# Altium schematic sheet MCU_RP2040.SchDoc: 06 - Controlador deterministico RP2040
size A3; Project: CM5 Photonic Bias Controller; DocumentRev: R5; ProjectRev: R5; Version: Rev R6; SheetNumber: 7; SheetTotal: 17; Author: Carlos Renan; SCH_SCALE: N/A; Address1: UFCG; Address2: Referencia: VIRTUS CC; Address3: Campina Grande - PB; ProjectName: Controle automatico de BIAS para MZM/IQ - Projeto 3; DocumentName: MCU_RP2040.SchDoc
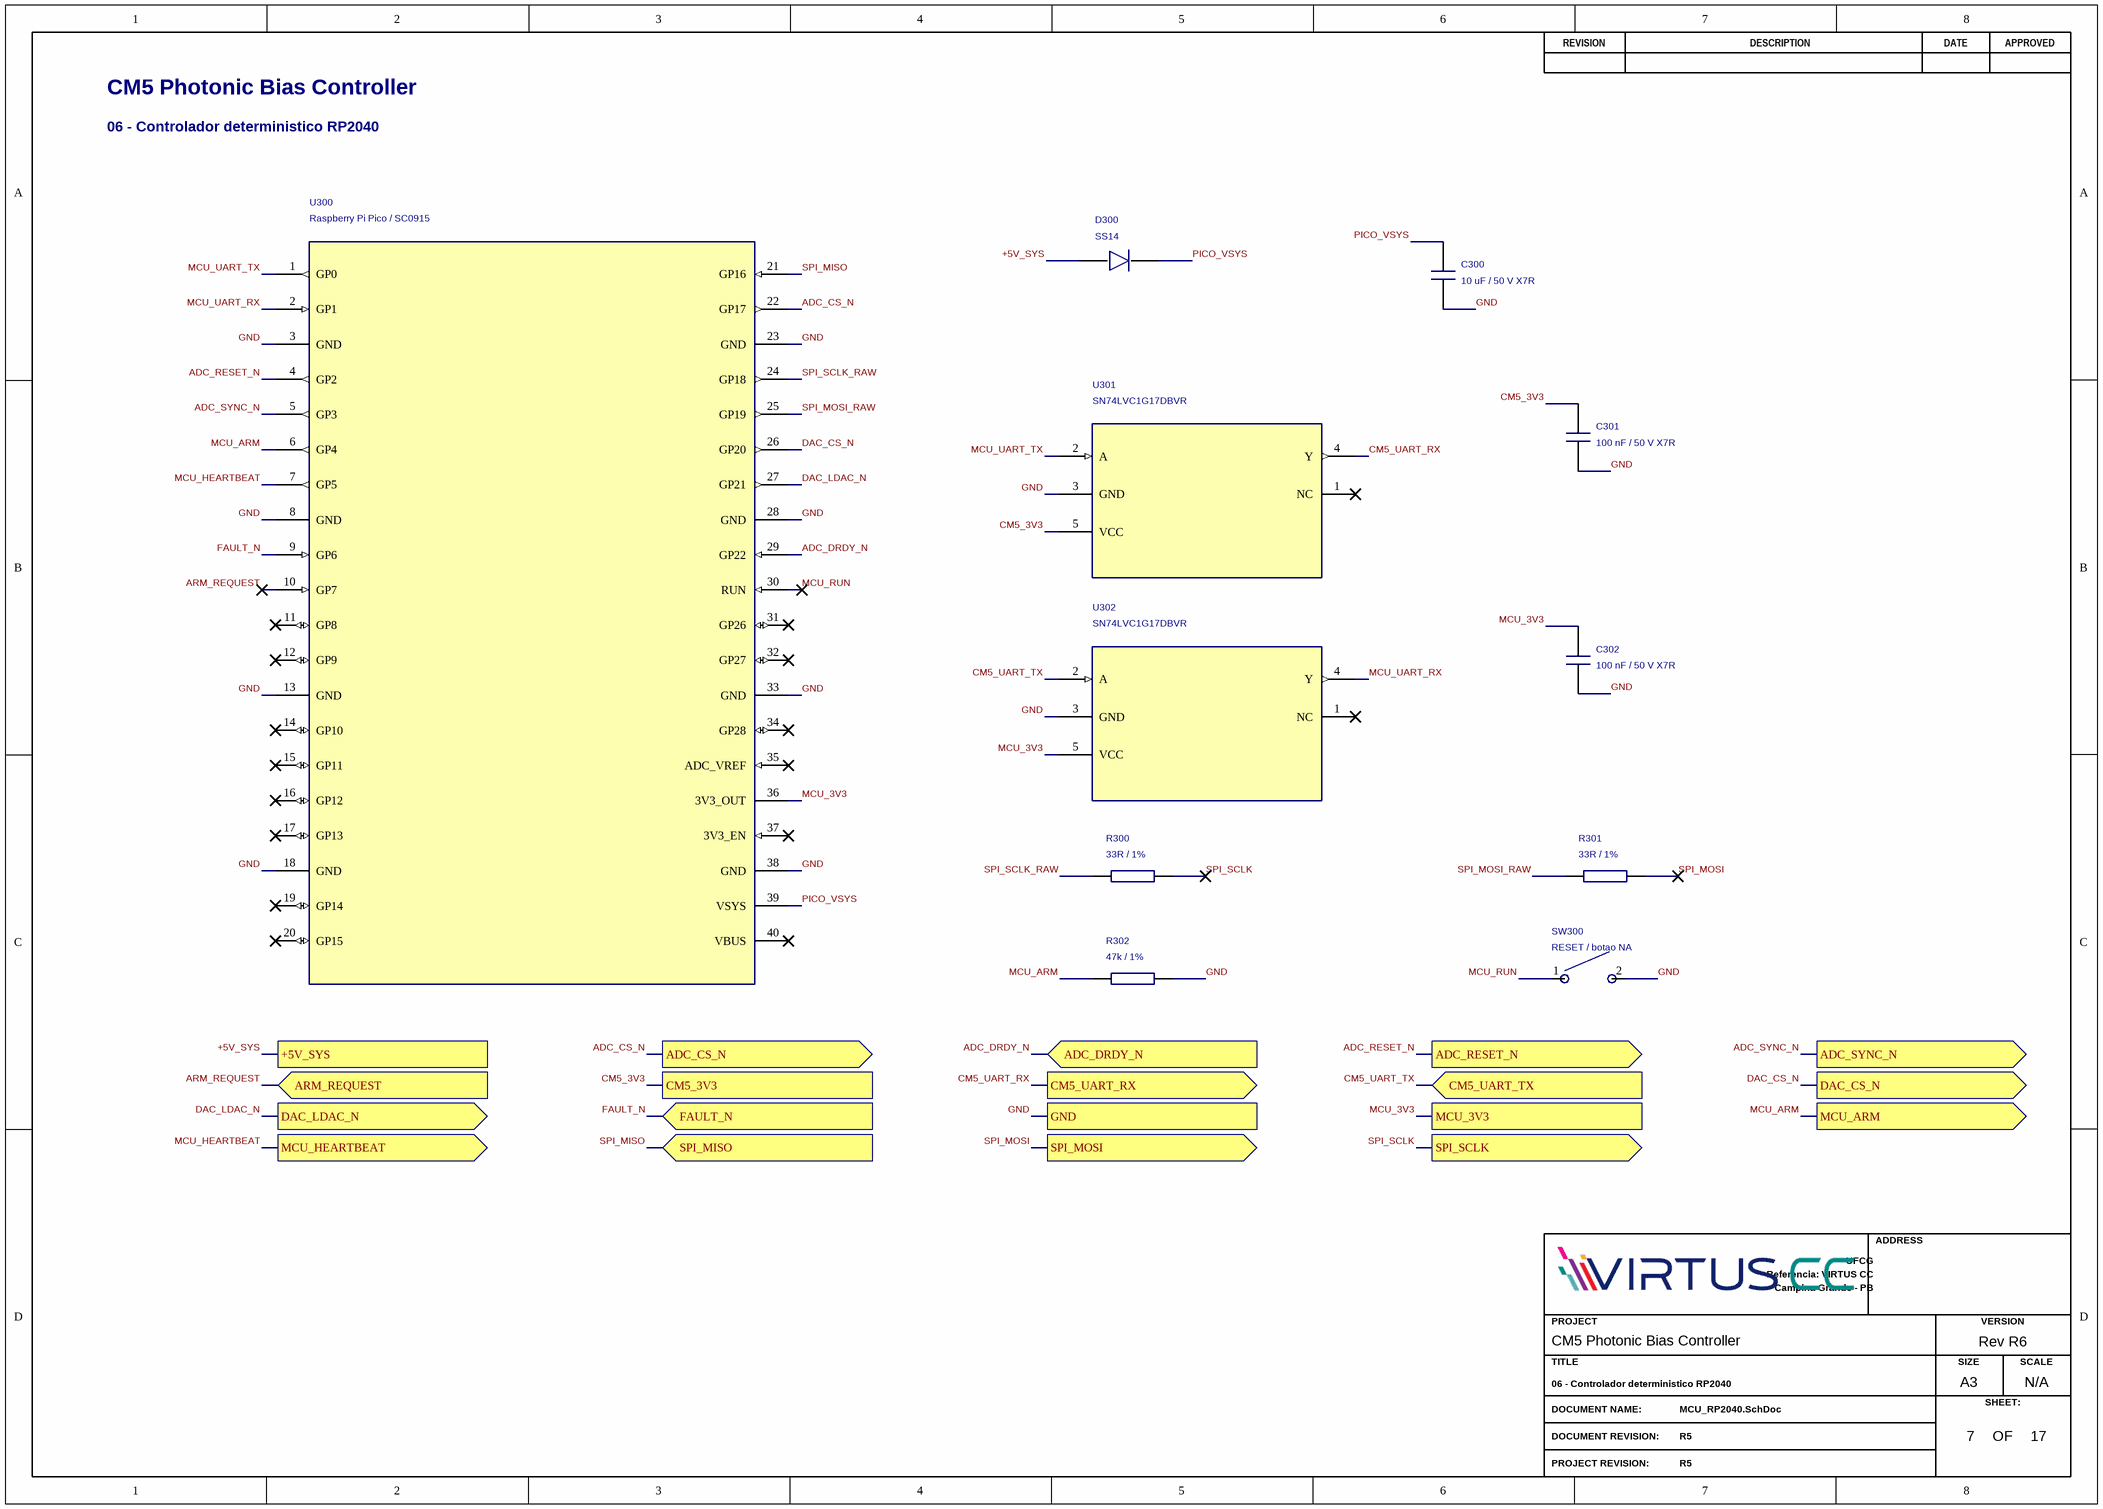
[diagram p0: MCU_RP2040.SchDoc]

## Parts
C300  10 uF / 50 V X7R  [C1210]
C301  100 nF / 50 V X7R  [C0805]
C302  100 nF / 50 V X7R  [C0805]
D300  SS14  [DO-214AC]
R300  33R / 1%  [R-0603]
R301  33R / 1%  [R-0603]
R302  47k / 1%  [R-0603]
SW300  RESET / botao NA  [SW_TL3305A]
U300  Raspberry Pi Pico / SC0915  [PICO_TH40]
U301  SN74LVC1G17DBVR  [FP-C04-091-OT-MFG]
U302  SN74LVC1G17DBVR  [FP-C04-091-OT-MFG]

## Ports
+5V_SYS, ADC_CS_N (out), ADC_DRDY_N (in), ADC_RESET_N (out), ADC_SYNC_N (out), ARM_REQUEST (in), CM5_3V3, CM5_UART_RX (out), CM5_UART_TX (in), DAC_CS_N (out), DAC_LDAC_N (out), FAULT_N (in), GND, MCU_3V3, MCU_ARM (out), MCU_HEARTBEAT (out), SPI_MISO (in), SPI_MOSI (out), SPI_SCLK (out)

## Nets
+5V_SYS: D300.2(A) ; port +5V_SYS
ADC_CS_N: U300.22(GP17) ; port ADC_CS_N
ADC_DRDY_N: U300.29(GP22) ; port ADC_DRDY_N
ADC_RESET_N: U300.4(GP2) ; port ADC_RESET_N
ADC_SYNC_N: U300.5(GP3) ; port ADC_SYNC_N
ARM_REQUEST: U300.10(GP7) ; port ARM_REQUEST
CM5_3V3: C301.1 U301.5(VCC) ; port CM5_3V3
CM5_UART_RX: U301.4(Y) ; port CM5_UART_RX
CM5_UART_TX: U302.2(A) ; port CM5_UART_TX
DAC_CS_N: U300.26(GP20) ; port DAC_CS_N
DAC_LDAC_N: U300.27(GP21) ; port DAC_LDAC_N
FAULT_N: U300.9(GP6) ; port FAULT_N
GND: C300.2 C301.2 C302.2 R302.2 SW300.2 U300.3(GND) U300.8(GND) U300.13(GND) U300.18(GND) U300.23(GND) U300.28(GND) U300.33(GND) U300.38(GND) U301.3(GND) U302.3(GND) ; port GND
MCU_3V3: C302.1 U300.36(3V3_OUT) U302.5(VCC) ; port MCU_3V3
MCU_ARM: R302.1 U300.6(GP4) ; port MCU_ARM
MCU_HEARTBEAT: U300.7(GP5) ; port MCU_HEARTBEAT
MCU_RUN: SW300.1 U300.30(RUN)
MCU_UART_RX: U300.2(GP1) U302.4(Y)
MCU_UART_TX: U300.1(GP0) U301.2(A)
PICO_VSYS: C300.1 D300.1(K) U300.39(VSYS)
SPI_MISO: U300.21(GP16) ; port SPI_MISO
SPI_MOSI: R301.2 ; port SPI_MOSI
SPI_MOSI_RAW: R301.1 U300.25(GP19)
SPI_SCLK: R300.2 ; port SPI_SCLK
SPI_SCLK_RAW: R300.1 U300.24(GP18)

Not connected (* = marked no-connect by the designer): U300 11(GP8)* 12(GP9)* 14(GP10)* 15(GP11)* 16(GP12)* 17(GP13)* 19(GP14)* 20(GP15)* 31(GP26)* 32(GP27)* 34(GP28)* 35(ADC_VREF)* 37(3V3_EN)* 40(VBUS)*; U301 1(NC)*; U302 1(NC)*

## Notes on the sheet
- CM5 Photonic Bias Controller
- 06 - Controlador deterministico RP2040
- REVISION
- DESCRIPTION
- DATE
- APPROVED
- ADDRESS
- PROJECT
- VERSION
- TITLE
- A3
- SIZE
- SCALE
- DOCUMENT NAME:
- DOCUMENT REVISION:
- OF
- SHEET:
- PROJECT REVISION:

## Library data of the parts
C300 = 10 uF: Manufacturer: KEMET; Manufacturer Part Number: C1210C106K5RACTU; Procurement Status: Busca por MPN; SKU e disponibilidade a confirmar; BOM Purchase: Yes; Manufacturer 1: KEMET; Manufacturer Part Number 1: C1210C106K5RACTU; Supplier 1: DigiKey; Supplier URL 1: https://www.digikey.com.br/pt/products/result?keywords=C1210C106K5RACTU; Supplier 2: Mouser; Supplier URL 2: https://br.mouser.com/c/?q=C1210C106K5RACTU; Datasheet: https://www.yageogroup.com/download/specsheet/C1210C106K5RACTU
C301 C302 = 100 nF: Manufacturer: KEMET; Manufacturer Part Number: C0805C104K5RACTU; Procurement Status: Busca por MPN; SKU e disponibilidade a confirmar; BOM Purchase: Yes; Manufacturer 1: KEMET; Manufacturer Part Number 1: C0805C104K5RACTU; Supplier 1: DigiKey; Supplier URL 1: https://www.digikey.com.br/pt/products/result?keywords=C0805C104K5RACTU; Supplier 2: Mouser; Supplier URL 2: https://br.mouser.com/c/?q=C0805C104K5RACTU; Datasheet: https://www.yageogroup.com/download/specsheet/C0805C104K5RACTU
D300 = SS14: Manufacturer: Diodes Incorporated; Manufacturer Part Number: SS14-13-F; Procurement Status: Busca por MPN; SKU e disponibilidade a confirmar; BOM Purchase: Yes; Manufacturer 1: Diodes Incorporated; Manufacturer Part Number 1: SS14-13-F; Supplier 1: DigiKey; Supplier URL 1: https://www.digikey.com.br/pt/products/result?keywords=SS14-13-F; Supplier 2: Mouser; Supplier URL 2: https://br.mouser.com/c/?q=SS14-13-F; Datasheet: https://www.diodes.com/datasheet/download/SS12.pdf
R300 R301 = 33R: Manufacturer: YAGEO; Manufacturer Part Number: RC0603FR-0733RL; Procurement Status: Busca por MPN; SKU e disponibilidade a confirmar; BOM Purchase: Yes; Manufacturer 1: YAGEO; Manufacturer Part Number 1: RC0603FR-0733RL; Supplier 1: DigiKey; Supplier URL 1: https://www.digikey.com.br/pt/products/result?keywords=RC0603FR-0733RL; Supplier 2: Mouser; Supplier URL 2: https://br.mouser.com/c/?q=RC0603FR-0733RL; Datasheet: https://www.yageo.com/en/Product/Index/rchip
R302 = 47k: Manufacturer: YAGEO; Manufacturer Part Number: RC0603FR-0747KL; Procurement Status: Busca por MPN; SKU e disponibilidade a confirmar; BOM Purchase: Yes; Manufacturer 1: YAGEO; Manufacturer Part Number 1: RC0603FR-0747KL; Supplier 1: DigiKey; Supplier URL 1: https://www.digikey.com.br/pt/products/result?keywords=RC0603FR-0747KL; Supplier 2: Mouser; Supplier URL 2: https://br.mouser.com/c/?q=RC0603FR-0747KL; Datasheet: https://www.yageo.com/en/Product/Index/rchip
SW300 = RESET: Manufacturer: E-Switch; Manufacturer Part Number: TL3305AF160QG; Review: Botao normalmente aberto; quatro pads fisicos, dois numeros eletricos repetidos.; Procurement Status: Busca por MPN; SKU e disponibilidade a confirmar; BOM Purchase: Yes; Manufacturer 1: E-Switch; Manufacturer Part Number 1: TL3305AF160QG; Supplier 1: DigiKey; Supplier URL 1: https://www.digikey.com.br/pt/products/result?keywords=TL3305AF160QG; Supplier 2: Mouser; Supplier URL 2: https://br.mouser.com/c/?q=TL3305AF160QG; Datasheet: https://www.e-switch.com/product-catalog/tl3305-series-tact-switch/
U300 = Raspberry Pi Pico: Review: Montagem THT com dois headers de 20 vias incluidos na lista de acessorios; sem pads SMT sob o modulo.; Procurement Status: Busca por MPN; SKU e disponibilidade a confirmar; BOM Purchase: Yes; Manufacturer: Raspberry Pi; Manufacturer Part Number: SC0915; Manufacturer 1: Raspberry Pi; Manufacturer Part Number 1: SC0915; Supplier 1: DigiKey; Supplier URL 1: https://www.digikey.com.br/pt/products/result?keywords=SC0915; Supplier 2: Mouser; Supplier URL 2: https://br.mouser.com/c/?q=SC0915; Datasheet: https://datasheets.raspberrypi.com/pico/pico-datasheet.pdf
U301 U302 = SN74LVC1G17DBVR: Manufacturer: Texas Instruments; Procurement Status: Busca por MPN; SKU e disponibilidade a confirmar; BOM Purchase: Yes; Manufacturer Part Number: SN74LVC1G17DBVR; Manufacturer 1: Texas Instruments; Manufacturer Part Number 1: SN74LVC1G17DBVR; Supplier 1: DigiKey; Supplier URL 1: https://www.digikey.com.br/pt/products/result?keywords=SN74LVC1G17DBVR; Supplier 2: Mouser; Supplier URL 2: https://br.mouser.com/c/?q=SN74LVC1G17DBVR; Datasheet: https://www.ti.com/lit/ds/symlink/sn74lvc1g17.pdf